# Altium project Fob_Transmitter_V4.0.PrjPcb (part 3 of 3)
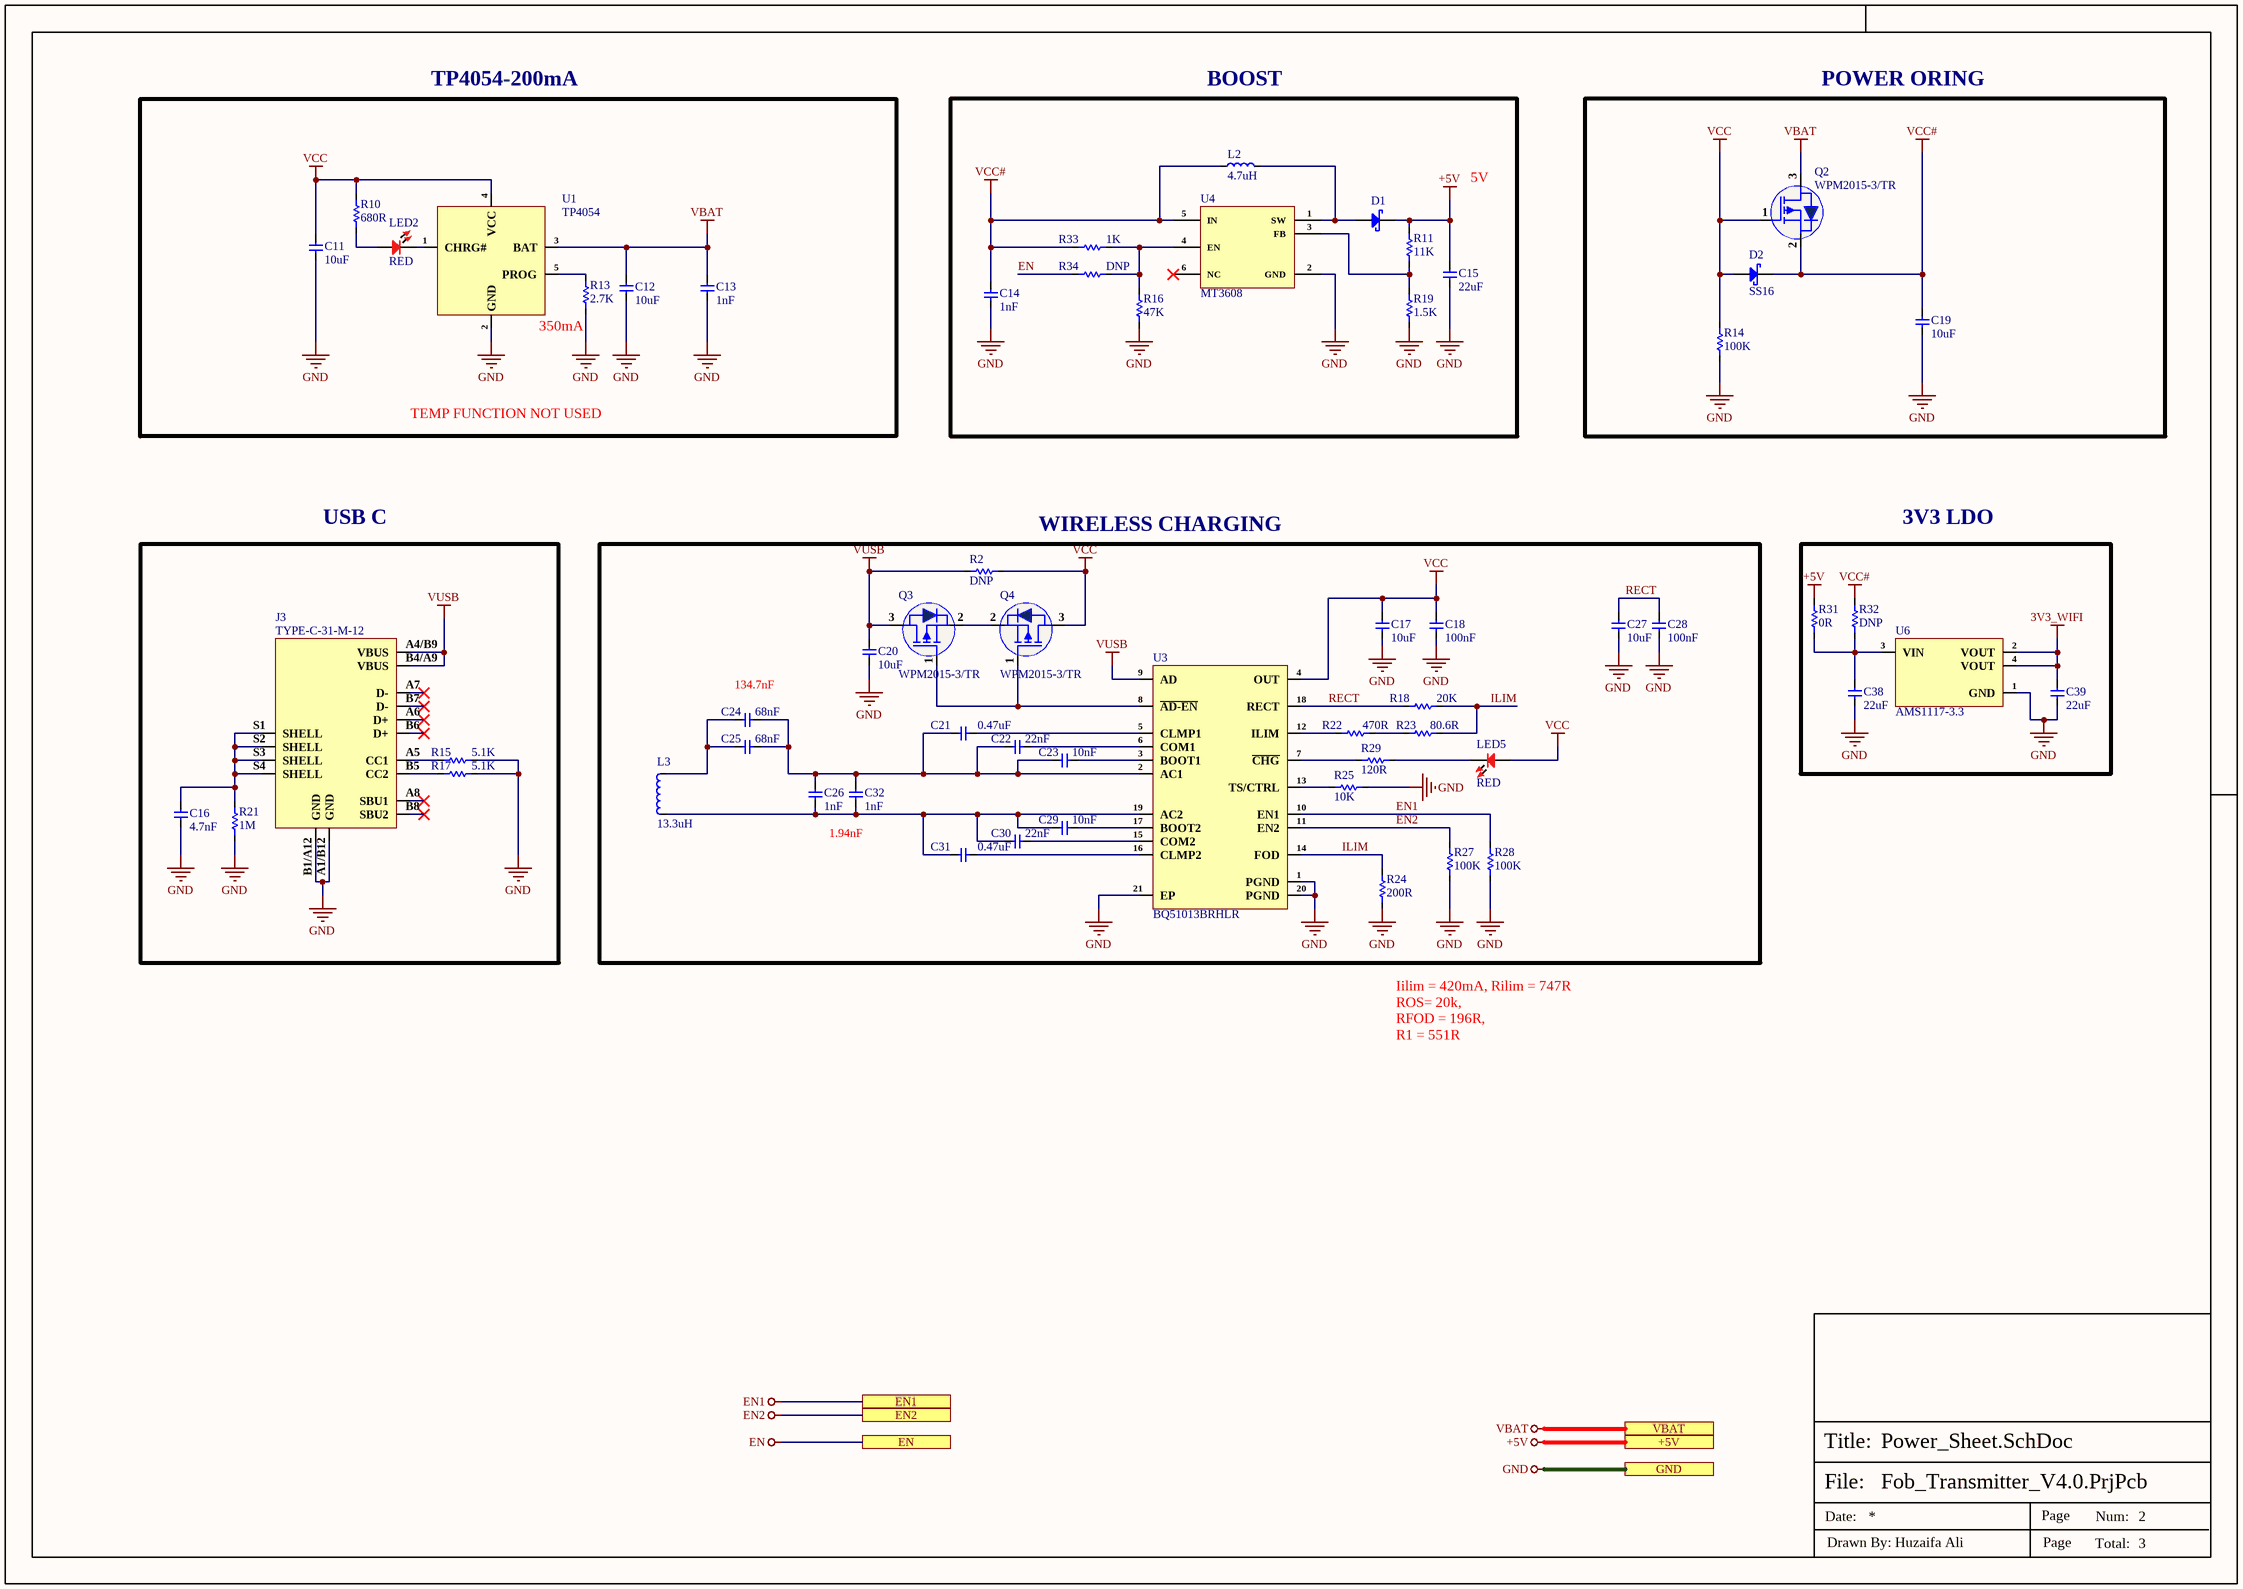
[diagram p4: Power_Sheet.SchDoc]

## Sheet Power_Sheet.SchDoc (continued)

### Library data of the parts (continued)
U6 = AMS1117-3.3: SOT-223 Linear Voltage Regulators (LDO) ROHS; Manufacturer: GUOXIN JIAPIN SEMICONDUCTOR; Item Type: IC; Manufacturer Part Number: AMS1117-3.3; Package: SOT-223; LCSC Part Number: C2992570; ComponentLink1Description: LCSC; ComponentLink1URL: https://www.lcsc.com/product-detail/Linear-Voltage-Regulators-LDO_GUOXIN-JIAPIN-SEMICONDUCTOR-AMS1117-3-3_C2992570.html

## Sheet Transmitter_Section.SchDoc
size 420 x 297 mm; SheetNumber: 3; SheetTotal: 3
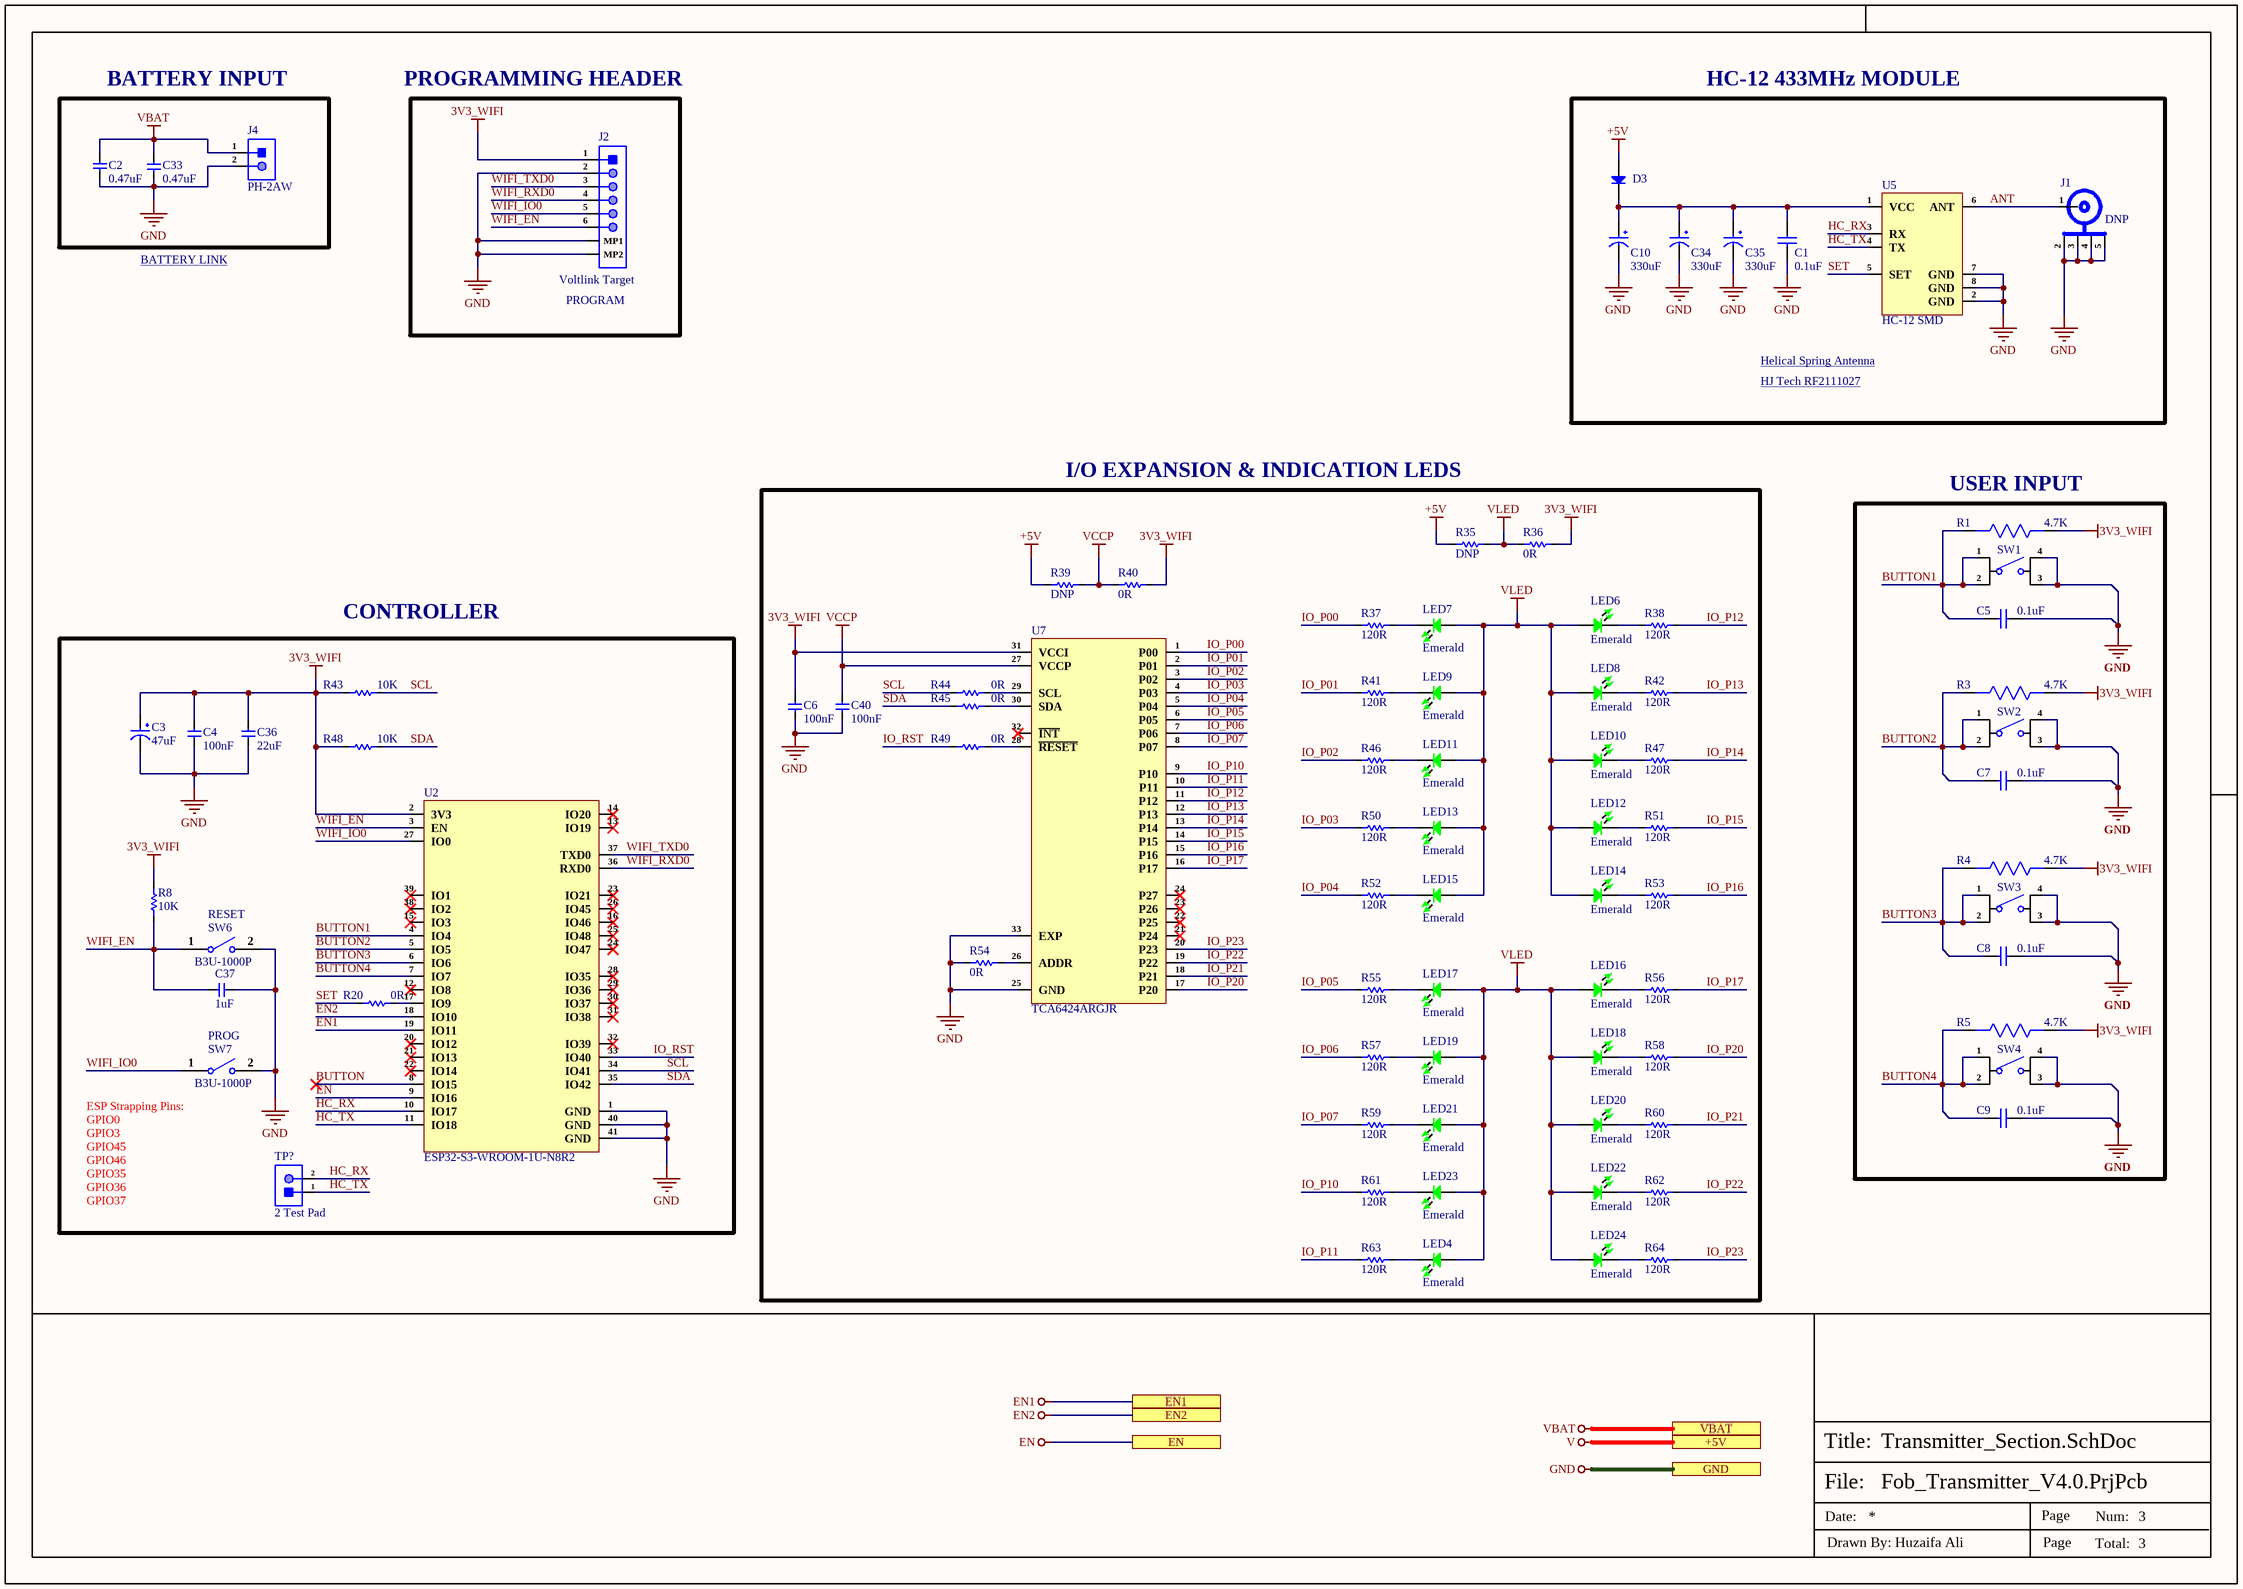
[diagram p2: Transmitter_Section.SchDoc]

### Parts
C1  0.1uF  [Cap0603]
C2  0.47uF  [Cap-0402]
C3  47uF  [Case-B]
C4  100nF  [Cap-0402]
C5  0.1uF  [Cap0603]
C6  100nF  [Cap-0402]
C7  0.1uF  [Cap0603]
C8  0.1uF  [Cap0603]
C9  0.1uF  [Cap0603]
C10  330uF  [Case-D]
C33  0.47uF  [Cap-0603]
C34  330uF  [Case-D]
C35  330uF  [Case-D]
C36  22uF  [Cap-0603]
C37  1uF  [Cap-0402]
C40  100nF  [Cap-0402]
D3  1N4007- SMD  [SMA(DO-214AC)]  (value not drawn)
J1  DNP  [CON-SMA-EDGE_S]
J2  Voltlink Target  [Voltlink Target]
J4  PH-2AW  [PH-2AW]
LED4  Emerald  [LED-0603]
LED6  Emerald  [LED-0603]
LED7  Emerald  [LED-0603]
LED8  Emerald  [LED-0603]
LED9  Emerald  [LED-0603]
LED10  Emerald  [LED-0603]
LED11  Emerald  [LED-0603]
LED12  Emerald  [LED-0603]
LED13  Emerald  [LED-0603]
LED14  Emerald  [LED-0603]
LED15  Emerald  [LED-0603]
LED16  Emerald  [LED-0603]
LED17  Emerald  [LED-0603]
LED18  Emerald  [LED-0603]
LED19  Emerald  [LED-0603]
LED20  Emerald  [LED-0603]
LED21  Emerald  [LED-0603]
LED22  Emerald  [LED-0603]
LED23  Emerald  [LED-0603]
LED24  Emerald  [LED-0603]
R1  4.7K  [RES-0603]
R3  4.7K  [RES-0603]
R4  4.7K  [RES-0603]
R5  4.7K  [RES-0603]
R8  10K  [Res-0402]
R20  0R  [Res-0402]
R35  DNP  [Res-0603]
R36  0R  [Res-0603]
R37  120R  [Res-0402]
R38  120R  [Res-0402]
R39  DNP  [Res-0603]
R40  0R  [Res-0603]
R41  120R  [Res-0402]
R42  120R  [Res-0402]
R43  10K  [Res-0402]
R44  0R  [Res-0402]
R45  0R  [Res-0402]
R46  120R  [Res-0402]
R47  120R  [Res-0402]
R48  10K  [Res-0402]
R49  0R  [Res-0402]
R50  120R  [Res-0402]
R51  120R  [Res-0402]
R52  120R  [Res-0402]
R53  120R  [Res-0402]
R54  0R  [Res-0402]
R55  120R  [Res-0402]
R56  120R  [Res-0402]
R57  120R  [Res-0402]
R58  120R  [Res-0402]
R59  120R  [Res-0402]
R60  120R  [Res-0402]
R61  120R  [Res-0402]
R62  120R  [Res-0402]
R63  120R  [Res-0402]
R64  120R  [Res-0402]
SW1  TSA016A2518A  [TSA016A2518A]  (value not drawn)
SW2  TSA016A2518A  [TSA016A2518A]  (value not drawn)
SW3  TSA016A2518A  [TSA016A2518A]  (value not drawn)
SW4  TSA016A2518A  [TSA016A2518A]  (value not drawn)
SW6  B3U-1000P  [B3U-1000P]
SW7  B3U-1000P  [B3U-1000P]
TP?  2 Test Pad  [2 Test Pad]  (no BOM)
U2  ESP32-S3-WROOM-1U-N8R2  [41-SMD UFL Module]
U5  HC-12 SMD  [HC-12 Module SMD]
U7  TCA6424ARGJR  [32-UQFN (5x5)]

### Blocks framed on the sheet
BATTERY INPUT: C2 C33 J4
PROGRAM: J2
HC-12 433MHz MODULE: C1 C10 C34 C35 D3 J1 U5
I/O EXPANSION & INDICATION LEDS: C6 C40 LED4 LED6-LED24 R35-R42 R44-R47 R49-R64 U7
USER INPUT: C5 C7-C9 R1 R3-R5 SW1-SW4
CONTROLLER: C3 C4 C36 C37 R8 R20 R43 R48 SW6 SW7 TP? U2

### Ports
+5V, EN, EN1, EN2, GND, VBAT

### Nets
3V3_WIFI: C3.1 C4.2 C6.2 C36.2 J2.1 R1.1 R3.1 R4.1 R5.1 R8.2 R36.2 R40.2 R43.1 R48.1 U2.2(3V3) U7.31(VCCI)
+5V: D3.2(A) R35.1 R39.1 ; port +5V  [also labelled V]
EN: U2.9(IO16) ; port EN
EN1: U2.19(IO11) ; port EN1
EN2: U2.18(IO10) ; port EN2
GND: C1.2 C2.2 C3.2 C4.1 C5.2 C6.1 C7.2 C8.2 C9.2 C10.2 C33.1 C34.2 C35.2 C36.1 C37.1 C40.1 J1.2(GND) J1.3(GND) J1.4(GND) J1.5(GND) J2.2 J2.MP1 J2.MP2 J4.2 R54.1 SW1.3 SW1.4 SW2.3 SW2.4 SW3.3 SW3.4 SW4.3 SW4.4 SW6.2 SW7.2 U2.1(GND) U2.40(GND) U2.41(GND) U5.2(GND) U5.7(GND) U5.8(GND) U7.25(GND) U7.33(EXP) ; port GND
VBAT: C2.1 C33.2 J4.1 ; port VBAT
VCCP: C40.2 R39.2 R40.1 U7.27(VCCP)
VLED: LED4.1 LED6.1 LED7.1 LED8.1 LED9.1 LED10.1 LED11.1 LED12.1 LED13.1 LED14.1 LED15.1 LED16.1 LED17.1 LED18.1 LED19.1 LED20.1 LED21.1 LED22.1 LED23.1 LED24.1 R35.2 R36.1
ANT: J1.1(ANT) U5.6(ANT)
BUTTON: U2.8(IO15)
BUTTON1: C5.1 R1.2 SW1.1 SW1.2 U2.4(IO4)
BUTTON2: C7.1 R3.2 SW2.1 SW2.2 U2.5(IO5)
BUTTON3: C8.1 R4.2 SW3.1 SW3.2 U2.6(IO6)
BUTTON4: C9.1 R5.2 SW4.1 SW4.2 U2.7(IO7)
HC_RX: TP?.2 U2.10(IO17) U5.3(RX)
HC_TX: TP?.1 U2.11(IO18) U5.4(TX)
IO_P00: R37.2 U7.1(P00)
IO_P01: R41.2 U7.2(P01)
IO_P02: R46.2 U7.3(P02)
IO_P03: R50.2 U7.4(P03)
IO_P04: R52.2 U7.5(P04)
IO_P05: R55.2 U7.6(P05)
IO_P06: R57.2 U7.7(P06)
IO_P07: R59.2 U7.8(P07)
IO_P10: R61.2 U7.9(P10)
IO_P11: R63.2 U7.10(P11)
IO_P12: R38.1 U7.11(P12)
IO_P13: R42.1 U7.12(P13)
IO_P14: R47.1 U7.13(P14)
IO_P15: R51.1 U7.14(P15)
IO_P16: R53.1 U7.15(P16)
IO_P17: R56.1 U7.16(P17)
IO_P20: R58.1 U7.17(P20)
IO_P21: R60.1 U7.18(P21)
IO_P22: R62.1 U7.19(P22)
IO_P23: R64.1 U7.20(P23)
IO_RST: R49.1 U2.33(IO40)
SCL: R43.2 R44.1 U2.34(IO41)
SDA: R45.1 R48.2 U2.35(IO42)
SET: R20.1 U5.5(SET)
WIFI_EN: C37.2 J2.6 R8.1 SW6.1 U2.3(EN)
WIFI_IO0: J2.5 SW7.1 U2.27(IO0)
WIFI_RXD0: J2.4 U2.36(RXD0)
WIFI_TXD0: J2.3 U2.37(TXD0)
NetC1_1: C1.1 C10.1 C34.1 C35.1 D3.1(K) U5.1(VCC)
NetLED4_2: LED4.2 R63.1
NetLED6_2: LED6.2 R38.2
NetLED7_2: LED7.2 R37.1
NetLED8_2: LED8.2 R42.2
NetLED9_2: LED9.2 R41.1
NetLED10_2: LED10.2 R47.2
NetLED11_2: LED11.2 R46.1
NetLED12_2: LED12.2 R51.2
NetLED13_2: LED13.2 R50.1
NetLED14_2: LED14.2 R53.2
NetLED15_2: LED15.2 R52.1
NetLED16_2: LED16.2 R56.2
NetLED17_2: LED17.2 R55.1
NetLED18_2: LED18.2 R58.2
NetLED19_2: LED19.2 R57.1
NetLED20_2: LED20.2 R60.2
NetLED21_2: LED21.2 R59.1
NetLED22_2: LED22.2 R62.2
NetLED23_2: LED23.2 R61.1
NetLED24_2: LED24.2 R64.2
NetR20_2: R20.2 U2.17(IO9)
NetR44_2: R44.2 U7.29(SCL)
NetR45_2: R45.2 U7.30(SDA)
NetR49_2: R49.2 U7.28(~{RESET})
NetR54_2: R54.2 U7.26(ADDR)

Not connected (* = marked no-connect by the designer): U2 12(IO8)* 13(IO19)* 14(IO20)* 15(IO3)* 16(IO46)* 20(IO12)* 21(IO13)* 22(IO14)* 23(IO21)* 24(IO47)* 25(IO48)* 26(IO45)* 28(IO35)* 29(IO36)* 30(IO37)* 31(IO38)* 32(IO39)* 38(IO2)* 39(IO1)*; U7 21(P24)* 22(P25)* 23(P26)* 24(P27)* 32(~{INT})*

### Notes on the sheet
- PROGRAMMING HEADER
- BATTERY LINK <https://vi.aliexpress.com/item/1005002734730431.html?spm=a2g0o.productlist.main.55.4fba3caeNMDezl&algo_pvid=2e614eb3-25ad-491b-9c35-52edbbf668ee&aem_p4p_detail=202408080529024132438273507200000717928&algo_exp_id=2e614eb3-25ad-491b-9c35-52edbbf668ee-27&pdp_npi=4%40dis%21USD%2113.00%218.60%21%21%2113.00%218.60%21%402141111917231201422858072e9bee%2112000028368129547%21sea%21AU%210%21ABX&curPageLogUid=a248Mxs1e3zy&utparam-url=scene%3Asearch%7Cquery_from%3A&search_p4p_id=202408080529024132438273507200000717928_7>
- Helical Spring Antenna <https://www.lcsc.com/product-detail/Antennas_Vollgo-VG433SNX39-6W3_C718844.html>
- HJ Tech RF2111027 <https://www.lcsc.com/product-detail/Antennas_HJ-Tech-RF2111027_C2936948.html>
- (near SW6) RESET
- PROG
- (near SW7) ESP Strapping Pins:
  GPIO0
  GPIO3
  GPIO45
  GPIO46
  GPIO35
  GPIO36
  GPIO37
- File:
- Title:
- Date:
- Page
- Num:
- Total:
- Drawn By: Huzaifa Ali

### Library data of the parts
C1 C5 C7-C9 = CC0603ZRY5V9BB104: CAP CER 0.1UF 50V Y5V 0603; Manufacturer: Yageo; Capacitance: 100nF; Tolerance: 80%; Supplier 1: Digi-Key; Manufacturer Part Number: CC0603ZRY5V9BB104; Stock 1: 15000880; Pricing 1: 1=0.1, 10=0.075, 100=0.0334, 500=0.02386, 1000=0.01874 (USD); Mount: Surface Mount; Case/Package: 0603; Number of Pins: 2; Case Code (Metric): 1608; Case Code (Imperial): 0603; Min Operating Temperature: -30°C; Max Operating Temperature: 85°C; Dielectric: Y5V; Voltage Rating: 50V; Package Quantity: 1; Packaging: Tape and Reel; Voltage Rating (DC): 50V; Termination: SMD/SMT; Composition: Ceramic; Voltage: 50V; Length: 1.6mm; Height: 0.8mm; Width: 0.031inch; Thickness: 0.035inch; Depth: 0.8mm; Radiation Hardening: No; REACH SVHC: No SVHC; Lead Free: Lead Free; Halogen Free: Halogen Free; ComponentLink1URL: http://www.yageo.com/documents/recent/UPY-GPHC_Y5V_6.3V-to-50V_8.pdf?src-supplier=Digi-Key; ComponentLink1Description: http://www.yageo.com/documents/recent/UPY-GPHC_Y5V_6.3V-to-50V_8.pdf?src-supplier=Digi-Key; ComponentLink2URL: http://www.yageo.com/documents/recent/UPY-GPHC_Y5V_6.3V-to-50V_5.pdf?src-supplier=Avnet+Europe; ComponentLink2Description: http://www.yageo.com/documents/recent/UPY-GPHC_Y5V_6.3V-to-50V_5.pdf?src-supplier=Avnet+Europe; ComponentLink3URL: https://www.verical.com/server-webapp/html/getDatasheet?partID=403611&src-supplier=Verical; ComponentLink3Description: https://www.verical.com/server-webapp/html/getDatasheet?partID=403611&src-supplier=Verical; ComponentLink4URL: http://www.mouser.com/ds/2/447/Yageo_UPY-GP_NP0_16V-to-50V_9-358835.pdf?src-supplier=Mouser; ComponentLink4Description: http://www.mouser.com/ds/2/447/Yageo_UPY-GP_NP0_16V-to-50V_9-358835.pdf?src-supplier=Mouser; ComponentLink5URL: http://www.farnell.com/datasheets/1132289.pdf?src-supplier=Element14; ComponentLink5Description: http://www.farnell.com/datasheets/1132289.pdf?src-supplier=Element14; Supplier Part Number 1: 311-1343-1-ND
C2 = CC0402KRX5R7BB474: CAP CER 0.47UF 16V X5R 0402; Manufacturer: Yageo; Capacitance: 470nF; Tolerance: 10%; Item Type: Capacitor; Supplier 1: Future Electronics; Manufacturer Part Number: CC0402KRX5R7BB474; RoHS: Yes; Category: Ceramic Capacitors; Stock 1: 10000; Pricing 1: 10000=0.01840, 20000=0.01800, 40000=0.01760, 50000=0.01750, 150000=0.01670 (USD); Mount: Surface Mount; Case/Package: 0402; Min Operating Temperature: -55°C; Max Operating Temperature: 85°C; Packaging: Tape and Reel; Voltage Rating: 16V; Voltage Rating (DC): 16V; Length: 0.039inch; Width: 0.02inch; Thickness: 0.022inch; Lead Free: Lead Free; Halogen Free: Halogen Free; RoHS Compliant: Yes; ComponentLink1URL: http://www.yageo.com/documents/recent/UPY-GPHC_X5R_4V-to-50V_25.pdf?src-supplier=Digi-Key; ComponentLink1Description: http://www.yageo.com/documents/recent/UPY-GPHC_X5R_4V-to-50V_25.pdf?src-supplier=Digi-Key; ComponentLink2URL: http://www.yageo.com/exep/pages/download/literatures/ProductSelectionGuide%202014_Final_2.pdf?src-supplier=Digi-Key; ComponentLink2Description: http://www.yageo.com/exep/pages/download/literatures/ProductSelectionGuide%202014_Final_2.pdf?src-supplier=Digi-Key; Supplier Part Number 1: 1070400; LCSC Part Number: C527010
C3 = TPSB476K010R0250: CAP TANT 47UF 10% 10V 1411; Manufacturer: Kyocera AVX; Item Type: Tantalum Capacitors; Life (Hours): 2000Hour; Ripple Current: 583mA; Supplier: Digikey; LCSC Part Number: C308881; Manufacturer Part Number: TPSB476K010R0250; RoHS: Yes; Stock: 118032; Pricing: 1=0.78, 10=0.488, 50=0.3748, 100=0.3397, 500=0.28054, 1000=0.26226 (USD); Lead Free: 5697LeadFree; RoHS Compliant: 5897YesNo; ComponentLink1URL: https://datasheet.ciiva.com/16328/tps-16328667.pdf?src-supplier=Future+Electronics; ComponentLink1Description: https://datasheet.ciiva.com/16328/tps-16328667.pdf?src-supplier=Future+Electronics; ComponentLink2URL: https://datasheet.ciiva.com/7713/1680477-7713437.pdf?src-supplier=Element14; ComponentLink2Description: https://datasheet.ciiva.com/7713/1680477-7713437.pdf?src-supplier=Element14; ComponentLink3URL: https://datasheet.ciiva.com/14590/70001047-14590282.pdf?src-supplier=Allied+Electronics; ComponentLink3Description: https://datasheet.ciiva.com/14590/70001047-14590282.pdf?src-supplier=Allied+Electronics; ComponentLink4URL: https://datasheet.ciiva.com/14593/70001047-14593294.pdf?src-supplier=Allied+Electronics; ComponentLink4Description: https://datasheet.ciiva.com/14593/70001047-14593294.pdf?src-supplier=Allied+Electronics; ComponentLink5URL: https://datasheet.ciiva.com/3004/tps-3004609.pdf?src-supplier=Avnet; ComponentLink5Description: https://datasheet.ciiva.com/3004/tps-3004609.pdf?src-supplier=Avnet; ComponentLink6URL: https://datasheet.ciiva.com/264/tps-264094.pdf?src-supplier=Digikey; ComponentLink6Description: https://datasheet.ciiva.com/264/tps-264094.pdf?src-supplier=Digikey; ComponentLink7URL: https://datasheet.ciiva.com/264/tps-264095.pdf?src-supplier=Digikey; ComponentLink7Description: https://datasheet.ciiva.com/264/tps-264095.pdf?src-supplier=Digikey; ComponentLink8URL: https://datasheet.ciiva.com/264/tps-264096.pdf?src-supplier=Digikey; ComponentLink8Description: https://datasheet.ciiva.com/264/tps-264096.pdf?src-supplier=Digikey
C4 C6 C40 = CC0402KRX5R8BB104: CAP CER 0.1UF 25V X5R 0402; Manufacturer: Yageo; Tolerance: 10%; Item Type: Capacitor; Supplier 1: Digi-Key; Manufacturer Part Number: CC0402KRX5R8BB104; RoHS: Yes; Category: Ceramic Capacitors; Stock 1: 4598218; Pricing 1: 1=0.10000, 10=0.03800, 50=0.02100, 100=0.01710, 500=0.01224, 1000=0.00961, 2500=0.00874, 5000=0.00804 (USD); Mount: Surface Mount; Case/Package: 0402; Case Code (Metric): 1005; Case Code (Imperial): 0402; Min Operating Temperature: -55°C; Max Operating Temperature: 85°C; Voltage Rating: 25V; Packaging: Tape and Reel; Capacitance: 100nF; Voltage Rating (DC): 25V; Dielectric: X5R; Resistor Type: Ceramic; Series: CC; Length: 0.039inch; Width: 0.02inch; Thickness: 0.022inch; Depth: 0.5mm; Lead Free: Lead Free; Halogen Free: Halogen Free; RoHS Compliant: Yes; ComponentLink1URL: http://www.mouser.com/ds/2/447/UPY-GPHC_X5R_4V-to-50V_25-1131599.pdf?src-supplier=Mouser; ComponentLink1Description: http://www.mouser.com/ds/2/447/UPY-GPHC_X5R_4V-to-50V_25-1131599.pdf?src-supplier=Mouser; ComponentLink2URL: http://www.yageo.com/documents/recent/UPY-GPHC_X5R_4V-to-50V-16.pdf?src-supplier=Future+Electronics; ComponentLink2Description: http://www.yageo.com/documents/recent/UPY-GPHC_X5R_4V-to-50V-16.pdf?src-supplier=Future+Electronics; ComponentLink3URL: http://www.yageo.com/documents/recent/UPY-GPHC_X5R_4V-to-50V_25.pdf?src-supplier=Digi-Key; ComponentLink3Description: http://www.yageo.com/documents/recent/UPY-GPHC_X5R_4V-to-50V_25.pdf?src-supplier=Digi-Key; Supplier Part Number 1: 311-1697-1-ND; LCSC Part Number: C106256
C10 C34 C35 = TAJD337K010RNJ: CAP TANT 330UF 10% 10V 2917; Manufacturer: Kyocera AVX; Item Type: Capacitor; Dielectric Material: 5684ConductorMaterial; Life (Hours): 1000Hour; Ripple Current: 408mA; Manufacturer Part Number: TAJD337K010RNJ; LCSC Part Number: C7226; ComponentLink1Description: https://datasheet.ciiva.com/11794/0900766b802e69d0-11794408.pdf?src-supplier=Rs; ComponentLink1URL: https://datasheet.ciiva.com/11794/0900766b802e69d0-11794408.pdf?src-supplier=Rs; Supplier: Avnet; RoHS: Yes; Stock: 24500; Pricing: 500=0.37263 (USD); Lead Free: 5697LeadFree; ComponentLink2URL: https://datasheet.ciiva.com/19467/1236841-19467295.pdf?src-supplier=Jameco; ComponentLink2Description: https://datasheet.ciiva.com/19467/1236841-19467295.pdf?src-supplier=Jameco; Voltage Rating (AC): 10V; ComponentLink3URL: https://datasheet.ciiva.com/26944/getdatasheetpartid-149137-26944845.pdf?src-supplier=Verical; ComponentLink3Description: https://datasheet.ciiva.com/26944/getdatasheetpartid-149137-26944845.pdf?src-supplier=Verical; ComponentLink4URL: https://datasheet.ciiva.com/3004/taj-3004541.pdf?src-supplier=Avnet; ComponentLink4Description: https://datasheet.ciiva.com/3004/taj-3004541.pdf?src-supplier=Avnet; ComponentLink5URL: https://datasheet.ciiva.com/3004/taj-3004542.pdf?src-supplier=Avnet; ComponentLink5Description: https://datasheet.ciiva.com/3004/taj-3004542.pdf?src-supplier=Avnet; ComponentLink6URL: https://datasheet.ciiva.com/265/taj-265298.pdf?src-supplier=Digikey; ComponentLink6Description: https://datasheet.ciiva.com/265/taj-265298.pdf?src-supplier=Digikey; ComponentLink7URL: https://datasheet.ciiva.com/265/taj-265299.pdf?src-supplier=Digikey; ComponentLink7Description: https://datasheet.ciiva.com/265/taj-265299.pdf?src-supplier=Digikey; ComponentLink8URL: https://datasheet.ciiva.com/265/taj-265300.pdf?src-supplier=Digikey; ComponentLink8Description: https://datasheet.ciiva.com/265/taj-265300.pdf?src-supplier=Digikey; ComponentLink9URL: https://datasheet.ciiva.com/7832/1680476-7832489.pdf?src-supplier=Element14; ComponentLink9Description: https://datasheet.ciiva.com/7832/1680476-7832489.pdf?src-supplier=Element14; ComponentLink10URL: https://datasheet.ciiva.com/7832/1680476-7832490.pdf?src-supplier=Element14; ComponentLink10Description: https://datasheet.ciiva.com/7832/1680476-7832490.pdf?src-supplier=Element14; ComponentLink11URL: https://datasheet.ciiva.com/7832/1680476-7832491.pdf?src-supplier=Element14; ComponentLink11Description: https://datasheet.ciiva.com/7832/1680476-7832491.pdf?src-supplier=Element14
C33 = CC0603KRX5R9BB474: CAP CER 0.47UF 50V X5R 0603; Manufacturer: Yageo; Capacitance: 470nF; Tolerance: 10%; Item Type: Capacitor; Supplier 1: Digi-Key; Manufacturer Part Number: CC0603KRX5R9BB474; RoHS: Yes; Category: Ceramic Capacitors; Stock 1: 15145; Pricing 1: 1=0.45000, 10=0.31400, 50=0.22000, 100=0.18860, 500=0.14144, 1000=0.11944 (USD); Mount: Surface Mount; Case/Package: 0603; Min Operating Temperature: -55°C; Max Operating Temperature: 85°C; Packaging: Tape and Reel; Voltage Rating: 50V; Voltage Rating (DC): 50V; Dielectric: X5R; Length: 0.063inch; Width: 0.031inch; Thickness: 0.035inch; Lead Free: Lead Free; Halogen Free: Halogen Free; RoHS Compliant: Yes; ComponentLink1URL: https://www.mouser.com/ds/2/447/ProductSelectionGuide 2014_Final_2-1131690.pdf?src-supplier=Mouser; ComponentLink1Description: https://www.mouser.com/ds/2/447/ProductSelectionGuide 2014_Final_2-1131690.pdf?src-supplier=Mouser; ComponentLink2URL: http://www.yageo.com/documents/recent/UPY-GPHC_X5R_4V-to-50V_25.pdf?src-supplier=Digi-Key; ComponentLink2Description: http://www.yageo.com/documents/recent/UPY-GPHC_X5R_4V-to-50V_25.pdf?src-supplier=Digi-Key; ComponentLink3URL: http://www.yageo.com/exep/pages/download/literatures/ProductSelectionGuide%202014_Final_2.pdf?src-supplier=Digi-Key; ComponentLink3Description: http://www.yageo.com/exep/pages/download/literatures/ProductSelectionGuide%202014_Final_2.pdf?src-supplier=Digi-Key; Supplier Part Number 1: 311-4047-1-ND; LCSC Part Number: C513651
C36 = CC0603MRX5R6BB226: CAP CER 22UF 10V X5R 0603; Manufacturer: Yageo; Tolerance: 20%; Item Type: Capacitor; Supplier 1: Digi-Key; Manufacturer Part Number: CC0603MRX5R6BB226; RoHS: Yes; Category: Ceramic Capacitors; Stock 1: 19628; Pricing 1: 1=0.68000, 10=0.48000, 50=0.36300, 100=0.31610, 500=0.23416, 1000=0.19903 (USD); Mount: Surface Mount; Case/Package: 0603; Case Code (Metric): 1608; Case Code (Imperial): 0603; Weight: 7.1E-05oz; Min Operating Temperature: -55°C; Max Operating Temperature: 85°C; Packaging: Tape and Reel; Capacitance: 22uF; Voltage Rating: 10V; Dielectric: X5R; Termination: SMD/SMT; Voltage Rating (DC): 10V; Package Quantity: 4000; Length: 0.063inch; Width: 0.8mm; Height: 0.8mm; Thickness: 0.035inch; Lead Free: Lead Free; Halogen Free: Halogen Free; RoHS Compliant: Yes; ComponentLink1URL: http://www.mouser.com/ds/2/447/Yageo_UPY-GP_NP0_16V-to-50V_9-358835.pdf?src-supplier=Mouser; ComponentLink1Description: http://www.mouser.com/ds/2/447/Yageo_UPY-GP_NP0_16V-to-50V_9-358835.pdf?src-supplier=Mouser; ComponentLink2URL: http://www.yageo.com/documents/recent/UPY-GPHC_X5R_4V-to-50V_25.pdf?src-supplier=Digi-Key; ComponentLink2Description: http://www.yageo.com/documents/recent/UPY-GPHC_X5R_4V-to-50V_25.pdf?src-supplier=Digi-Key; Supplier Part Number 1: 311-1819-1-ND; LCSC Part Number: C109447
C37 = GRM155C71C105KE11D: CAP CER 1UF 16V X7S 0402; Manufacturer: Murata; Item Type: Capacitors; Material: 4241ConductorMaterial; Tolerance: 10%; Dielectric: 1542DielectricType; Supplier: Mouser; LCSC Part Number: C576449; Manufacturer Part Number: GRM155C71C105KE11D; RoHS: No; Stock: 16102; Pricing: 1=0.11, 10=0.041, 50=0.041, 100=0.026, 1000=0.023, 10000=0.016 (USD); Case/Package: 343Case; Min Operating Temperature: -55°C; Max Operating Temperature: 125°C; Value: 1uF; Voltage Rating: 16V; Voltage Rating (DC): 16V; Length: 1mm; Width: 500um; Height: 600um; Thickness: 500um
D3 = 1N4007- SMD: 1A Single 1kV 1.1V@1A SMA(DO-214AC) Diodes - General Purpose ROHS; Manufacturer: TWGMC; Manufacturer Part Number: 1N4007; Item Type: Diode; Package: SMA(DO-214AC); LCSC Part Number: C727081; ComponentLink1Description: LCSC; ComponentLink1URL: https://www.lcsc.com/product-detail/Diodes-General-Purpose_TWGMC-1N4007_C727081.html
J1 = CON-SMA-EDGE-S: Sma Female Connector, Pcb Edge Mount Rohs Compliant: Yes; Manufacturer: RF Solutions; Number of Ports: 1; Supplier 1: Rs; Manufacturer Part Number: CON-SMA-EDGE-S; RoHS: Yes; Category: RF / Coaxial Connectors; Stock 1: 4145; Pricing 1: 1=1.16, 10=0.96 (GBP); Mount: Edge,Board; Case/Package: SMA; Connector Type: SMA; Fastening Type: Threaded; Termination: Solder; Series: -; ComponentLink1URL: https://media.digikey.com/pdf/Data%20Sheets/RF%20Solutions%20PDFs/CON-SMA-EDGE.pdf?src-supplier=Digi-Key; ComponentLink1Description: https://media.digikey.com/pdf/Data%20Sheets/RF%20Solutions%20PDFs/CON-SMA-EDGE.pdf?src-supplier=Digi-Key; Package: THT; Item Type: Connector; Supplier Part Number 1: 1258191
J2 = C145963: 1x6P SH 1 1mm 6 SMD,P=1mm Wire To Board / Wire To Wire Connector ROHS; Manufacturer: BOOMELE; Manufacturer Part Number: C145963; Package: SMD,P=1mm; LCSC Part Number: C145963; Item Type: Connector; ComponentLink1Description: LCSC; ComponentLink1URL: https://www.lcsc.com/product-detail/Wire-To-Board-Wire-To-Wire-Connector_BOOMELE-Boom-Precision-Elec-C145963_C145963.html
J4 = PH-2AW: 1x2P 2P PH 1 Tin 2mm 2 -25℃~+85℃ Brass 2A Bend insert Push-Pull,P=2mm Wire To Board Connector ROHS; Manufacturer: HCTL; Manufacturer Part Number: PH-2AW; Package: Push-Pull,P=2mm; LCSC Part Number: C2908634; Item Type: Wire To Board Connector; ComponentLink1Description: LCSC; ComponentLink1URL: https://www.lcsc.com/product-detail/Wire-To-Board-Connector_HCTL-PH-2AW_C2908634.html
LED4 LED6-LED24 = NCD0603G2: Emerald 0603 Light Emitting Diodes (LED) ROHS; Manufacturer: Foshan NationStar Optoelectronics; Manufacturer Part Number: NCD0603G2; Package: 0603; LCSC Part Number: C87326; Item Type: LED; ComponentLink1Description: LCSC; ComponentLink1URL: https://www.lcsc.com/product-detail/Light-Emitting-Diodes-LED_Foshan-NationStar-Optoelectronics-NCD0603G2_C87326.html
R1 R3-R5 = RC0603FR-074K7L: RES SMD 4.7K OHM 1% 1/10W 0603; Manufacturer: Yageo; Resistance: 4.7kR; Temperature Coefficient: 100ppm/°C; Power Rating: 100mW; Voltage Rating (DC): 50V; Supplier 1: Digi-Key; Manufacturer Part Number: RC0603FR-074K7L; RoHS: Yes; Category: Chip SMD Resistors; Stock 1: 1924316; Pricing 1: 1=0.10000, 10=0.02400, 100=0.00970, 1000=0.00436, 2500=0.00378 (USD); Case/Package: 0603; Number of Pins: 2; Case Code (Imperial): 0603; Case Code (Metric): 1608; Size Code: 0603; Min Operating Temperature: -55°C; Max Operating Temperature: 155°C; Tolerance: 1%; Resistor Type: Thick Film; Packaging: Tape and Reel; Voltage Rating: 50V; Termination: SMD/SMT; Features: Moisture Resistant; Series: RC; Max Power Dissipation: 100mW; Number of Terminations: 2; Construction: Rectangular; Resistance Tolerance: 1%; Length: 1.6mm; Width: 0.8mm; Height: 0.45mm; Depth: 0.8mm; Lead Pitch: 0.3mm; REACH SVHC: No SVHC; Lead Free: Lead Free; RoHS Compliant: Yes; Military Standard: Not; ComponentLink1URL: https://datasheet.ciiva.com/15189/getdatasheetpartid-422754-15189760.pdf?src-supplier=Verical; ComponentLink1Description: https://datasheet.ciiva.com/15189/getdatasheetpartid-422754-15189760.pdf?src-supplier=Verical; ComponentLink2URL: https://datasheet.ciiva.com/22747/443971-22747528.pdf?src-supplier=Element14; ComponentLink2Description: https://datasheet.ciiva.com/22747/443971-22747528.pdf?src-supplier=Element14; ComponentLink3URL: https://datasheet.ciiva.com/7660/38590-7660794.pdf?src-supplier=Element14; ComponentLink3Description: https://datasheet.ciiva.com/7660/38590-7660794.pdf?src-supplier=Element14; ComponentLink4URL: https://datasheet.ciiva.com/7746/1868787-7746365.pdf?src-supplier=Element14; ComponentLink4Description: https://datasheet.ciiva.com/7746/1868787-7746365.pdf?src-supplier=Element14; ComponentLink5URL: https://datasheet.ciiva.com/46440/1868787-46440909.pdf?src-supplier=Element14; ComponentLink5Description: https://datasheet.ciiva.com/46440/1868787-46440909.pdf?src-supplier=Element14; ComponentLink6URL: https://datasheet.ciiva.com/7746/1738695-7746366.pdf?src-supplier=Element14; ComponentLink6Description: https://datasheet.ciiva.com/7746/1738695-7746366.pdf?src-supplier=Element14; Supplier Part Number 1: 311-4.70KHRCT-ND
R8 R43 R48 = RC0402FR-0710KL: RES 10K OHM 1% 1/16W 0402; Manufacturer: Yageo; Resistance: 10kR; Voltage Rating (DC): 50V; Temperature Coefficient: 100ppm/°C; Power Rating: 62.5mW; Max Power Dissipation: 63mW; Item Type: Resistor; Supplier 1: Mouser; Manufacturer Part Number: RC0402FR-0710KL; RoHS: Yes; Category: Chip SMD Resistors; Stock 1: 18648329; Pricing 1: 1=0.10000, 10=0.01400, 50=0.01400, 100=0.00500, 1000=0.00300, 10000=0.00200 (USD); Case/Package: 0402; Number of Pins: 2; Case Code (Imperial): 0402; Case Code (Metric): 1005; Min Operating Temperature: -55°C; Max Operating Temperature: 155°C; Resistor Type: Thick Film; Tolerance: 1%; Packaging: Tape and Reel; Voltage Rating: 50V; Termination: SMD/SMT; Working Voltage: 50V; Number of Terminations: 2; Features: Moisture Resistant; Series: RC; Resistance Tolerance: 1%; Construction: Rectangular; Length: 1mm; Width: 0.5mm; Height: 0.32mm; Depth: 0.5mm; Lead Pitch: 0.2mm; REACH SVHC: No SVHC; Lead Free: Lead Free; RoHS Compliant: Yes; Military Standard: Not; ComponentLink1URL: https://datasheet.ciiva.com/7660/38568-7660787.pdf?src-supplier=Element14; ComponentLink1Description: https://datasheet.ciiva.com/7660/38568-7660787.pdf?src-supplier=Element14; ComponentLink2URL: https://datasheet.ciiva.com/7849/1686128-7849814.pdf?src-supplier=Element14; ComponentLink2Description: https://datasheet.ciiva.com/7849/1686128-7849814.pdf?src-supplier=Element14; ComponentLink3URL: https://datasheet.ciiva.com/7983/1018594-7983486.pdf?src-supplier=Element14; ComponentLink3Description: https://datasheet.ciiva.com/7983/1018594-7983486.pdf?src-supplier=Element14; ComponentLink4URL: https://datasheet.ciiva.com/22747/1018594-22747512.pdf?src-supplier=Element14; ComponentLink4Description: https://datasheet.ciiva.com/22747/1018594-22747512.pdf?src-supplier=Element14; ComponentLink5URL: https://datasheet.ciiva.com/12667/pyu-rc0402-51-rohs-l-6-r-12667067.pdf?src-supplier=Mouser; ComponentLink5Description: https://datasheet.ciiva.com/12667/pyu-rc0402-51-rohs-l-6-r-12667067.pdf?src-supplier=Mouser; ComponentLink6URL: https://datasheet.ciiva.com/7849/1784430-7849813.pdf?src-supplier=Element14; ComponentLink6Description: https://datasheet.ciiva.com/7849/1784430-7849813.pdf?src-supplier=Element14; ComponentLink7URL: https://datasheet.ciiva.com/7849/1784430-7849815.pdf?src-supplier=Element14; ComponentLink7Description: https://datasheet.ciiva.com/7849/1784430-7849815.pdf?src-supplier=Element14; Supplier Part Number 1: 603-RC0402FR-0710KL; LCSC Part Number: C60490
R20 R44 R45 R49 R54 = RC0402FR-070RL: RES 0 OHM JUMPER 1/16W 0402; Manufacturer: Yageo; Item Type: Resistors; Tolerance: 1%; Power Rating: 62.5mW; Voltage Rating: 50V; Temperature Coefficient: 200ppm/°C; Max Power Dissipation: 63mW; Supplier 1: Mouser; Manufacturer Part Number: RC0402FR-070RL; RoHS: Yes; Stock 1: 8556842; Pricing 1: 1=0.10000, 10=0.01400, 50=0.01400, 100=0.00600, 1000=0.00300, 5000=0.00200, 10000=0.00100 (USD); Mount: Surface Mount; Case/Package: 0402; Contact Plating: Tin,Matte; Case Code (Imperial): 0402; Case Code (Metric): 1005; Size Code: 0402; Min Operating Temperature: -55°C; Max Operating Temperature: 155°C; Resistance: 0R; Resistor Type: Thick Film; Packaging: Tape and Reel; Termination: SMD/SMT; Features: Moisture Resistant; Series: RC; Number of Terminations: 2; Length: 1mm; Width: 0.5mm; Height: 0.35mm; Radiation Hardening: No; Lead Free: Lead Free; RoHS Compliant: Yes; ComponentLink1URL: https://datasheet.ciiva.com/8896/pyu-rc0402-51-rohs-l-6-8896149.pdf?src-supplier=Avnet; ComponentLink1Description: https://datasheet.ciiva.com/8896/pyu-rc0402-51-rohs-l-6-8896149.pdf?src-supplier=Avnet; ComponentLink2URL: https://datasheet.ciiva.com/16790/pyu-rc0402-51-rohs-l-6-r-16790444.pdf?src-supplier=Future+Electronics; ComponentLink2Description: https://datasheet.ciiva.com/16790/pyu-rc0402-51-rohs-l-6-r-16790444.pdf?src-supplier=Future+Electronics; Supplier Part Number 1: 603-RC0402FR-070RL; LCSC Part Number: C106231
R35 R36 R39 R40 = RC0603JR-070RL: RES 0 OHM JUMPER 1/10W 0603; Manufacturer: Yageo; Resistance: 0mR; Tolerance: 1%; Power Rating: 100mW; Voltage Rating (DC): 50V; Temperature Coefficient: 200ppm/°C; Resistance Tolerance: 5%; Item Type: Resistor; Supplier 1: Digi-Key; Manufacturer Part Number: RC0603JR-070RL; RoHS: Yes; Category: Chip SMD Resistors; Stock 1: 18081776; Pricing 1: 1=0.10000, 10=0.01700, 25=0.01240, 50=0.00960, 100=0.00700, 250=0.00536, 500=0.00430, 1000=0.00316 (USD); Case/Package: 0603; Number of Pins: 2; Contact Plating: Tin,Matte; Case Code (Imperial): 0603; Case Code (Metric): 1608; Size Code: 0603; Min Operating Temperature: -55°C; Max Operating Temperature: 155°C; Resistor Type: Thick Film; Packaging: Tape and Reel; Termination: SMD/SMT; Series: RC; Technology: THICK FILM; Package Quantity: 5000; Voltage Rating: 50V; Features: Moisture Resistant; Max Power Dissipation: 100mW; Number of Terminations: 2; Construction: Rectangular; Length: 1.6mm; Width: 0.8mm; Height: 0.45mm; Depth: 0.8mm; Radiation Hardening: No; Reach SVHC Compliant: No SVHC; Lead Free: Lead Free; RoHS Compliant: Yes; Military Standard: Not; Supplier Part Number 1: 311-0.0GRCT-ND; LCSC Part Number: C95177
R37 R38 R41 R42 R46 R47 R50-R53 R55-R64 = RC0402FR-07120RL: RES 120 OHM 1% 1/16W 0402; Manufacturer: Yageo; Item Type: Resistors; Power Rating: 62.5mW; Voltage Rating: 50V; Temperature Coefficient: 100ppm/°C; Max Power Dissipation: 63mW; Supplier: Future Electronics; Supplier Part Number: 4529079; Manufacturer Part Number: RC0402FR-07120RL; RoHS: Yes; Stock: 150000; Pricing: 10000=0.0012, 100000=0.0011, 300000=0.001, 750000=0.001, 2000000=0.0009 (USD); Case/Package: 0402; Case Code (Imperial): 0402; Case Code (Metric): 1005; Min Operating Temperature: -55°C; Max Operating Temperature: 155°C; Package Quantity: 1; Value: 120R; Tolerance: 1%; Packaging: Tape and Reel; Termination: SMD/SMT; Resistor Type: Thick Film; Number of Terminations: 2; Features: Moisture Resistant; Series: RC; Resistance Tolerance: 1%; Construction: Rectangular; Technology: THICK FILM; Voltage Rating (AC): 50V; Length: 0.039inch; Width: 0.02inch; Height: 0.016inch; Depth: 0.5mm; Reach SVHC Compliant: No; Military Standard: Not; RoHS Compliant: Yes; Lead Free: 5697LeadFree; ComponentLink1URL: https://datasheet.ciiva.com/12667/pyu-rc0402-51-rohs-l-6-r-12667958.pdf?src-supplier=Mouser; ComponentLink1Description: https://datasheet.ciiva.com/12667/pyu-rc0402-51-rohs-l-6-r-12667958.pdf?src-supplier=Mouser; ComponentLink2URL: https://datasheet.ciiva.com/7849/1018594-7849831.pdf?src-supplier=Element14; ComponentLink2Description: https://datasheet.ciiva.com/7849/1018594-7849831.pdf?src-supplier=Element14; LCSC Part Number: C114758
SW1-SW4 = TSA016A2518A: 3.35mm 2.5mm Oval button 50mA Brick nogging 4.2mm 180gf 12V SMD Tactile Switches ROHS; Manufacturer: BZCN; Manufacturer Part Number: TSA016A2518A; Package: SMD; LCSC Part Number: C2888427; Item Type: Tactile Switch; ComponentLink1Description: LCSC; ComponentLink1URL: https://jlcpcb.com/partdetail/Bzcn-TSA016A2518A/C2888427
SW6 SW7 = B3U-1000P: SWITCH TACTILE SPST-NO 0.05A 12V; Manufacturer: Omron; Mechanical Life: 200000Cycles; Operating Force: 1.5N; Throw Configuration: SPST; Current Rating: 50mA; Contact Resistance: 100mR; Illumination Type: Non-Illuminated,Illuminated; Switch Travel: 0.15mm; Switch Function: Off-Mom; Actuator Type: Standard; Actuator Length: 0.4mm; Ratings: Dust Proof,IP40; ComponentLink1URL: http://www.farnell.com/datasheets/60838.pdf?src-supplier=Farnell; ComponentLink1Description: http://www.farnell.com/datasheets/60838.pdf?src-supplier=Farnell; ComponentLink2URL: http://www.farnell.com/datasheets/60838.pdf?src-supplier=Element14; ComponentLink2Description: http://www.farnell.com/datasheets/60838.pdf?src-supplier=Element14; ComponentLink3URL: https://omronfs.omron.com/en_US/ecb/products/pdf/en-b3u.pdf?src-supplier=Digi-Key; ComponentLink3Description: https://omronfs.omron.com/en_US/ecb/products/pdf/en-b3u.pdf?src-supplier=Digi-Key; ComponentLink4URL: http://www.omron.com/ecb/products/pdf/en-b3u.pdf?src-supplier=Digi-Key; ComponentLink4Description: http://www.omron.com/ecb/products/pdf/en-b3u.pdf?src-supplier=Digi-Key; ComponentLink5URL: https://www.distrelec.biz/Web/Downloads/he/et/B3U_eng_datasheet.pdf?mime=application%2Fpdf&src-supplier=Distrelec; ComponentLink5Description: https://www.distrelec.biz/Web/Downloads/he/et/B3U_eng_datasheet.pdf?mime=application%2Fpdf&src-supplier=Distrelec; ComponentLink6URL: http://www.onlinecomponents.com/productFiles/mf-OM/en-b3u.pdf?src-supplier=Onlinecomponents.com; ComponentLink6Description: http://www.onlinecomponents.com/productFiles/mf-OM/en-b3u.pdf?src-supplier=Onlinecomponents.com; Supplier 1: Digi-Key; Manufacturer Part Number: B3U-1000P; Stock 1: 116454; Pricing 1: 1=1, 10=0.961, 25=0.9064, 50=0.7976, 100=0.7251, 250=0.68888, 500=0.67074, 1000=0.52571 (USD); Mount: Surface Mount; Weight: 0.000776oz; Contact Material: Silver; Min Operating Temperature: -25°C; Max Operating Temperature: 70°C; Packaging: Tape and Reel; Voltage Rating (DC): 12V; Package Quantity: 1; Max Current Rating: 50mA; Termination: SMD/SMT; Orientation: Straight; Max Voltage Rating (DC): 12V; Electrical Life: 200000Cycles; Insulation Resistance: 100MR; Contact Current Rating: 50mA; Length: 4mm; Height: 1.2mm; Depth: 2.5mm; Width: 3mm; REACH SVHC: Unknown; Lead Free: Lead Free; ComponentLink7URL: https://www.verical.com/server-webapp/html/getDatasheet?partID=552554&src-supplier=Verical; ComponentLink7Description: https://www.verical.com/server-webapp/html/getDatasheet?partID=552554&src-supplier=Verical; ComponentLink8URL: http://www.farnell.com/datasheets/1685550.pdf?src-supplier=Element14; ComponentLink8Description: http://www.farnell.com/datasheets/1685550.pdf?src-supplier=Element14; ComponentLink9URL: http://www.farnell.com/datasheets/2610940.pdf?src-supplier=Farnell; ComponentLink9Description: http://www.farnell.com/datasheets/2610940.pdf?src-supplier=Farnell; ComponentLink10URL: https://www.alliedelec.com/m/d/4c8a9ef82804fc3c241a13c1e298fd73.pdf?src-supplier=Allied+Electronics; ComponentLink10Description: https://www.alliedelec.com/m/d/4c8a9ef82804fc3c241a13c1e298fd73.pdf?src-supplier=Allied+Electronics; Supplier Part Number 1: SW1020DKR-ND; LCSC Part Number: C231329; Item Type: Switch
TP? = 2 Test Pad: Wire Connecting Pad; Item Type: Test Point; Manufacturer Part Number: 2 Test Pad
U2 = ESP32-S3-WROOM-1U-N8R2: RF TXRX MOD BT WIFIU.FL SMD; Manufacturer: Espressif Systems; Item Type: Module; Supplier: Digikey; LCSC Part Number: 1965-ESP32-S3-WROOM-1U-N8R2CT-ND; Manufacturer Part Number: ESP32-S3-WROOM-1U-N8R2; RoHS: No; Stock: 6440; Pricing: 1=5.71, 10=4.941, 25=4.6748, 100=4.3087, 250=4.0894 (USD)
U5 = HC-12 SMD: HC12 Si4463 433MHZ RF Wireless Serial Module; Manufacturer Part Number: HC-12; Package: Custom; Item Type: Module
U7 = TCA6424ARGJR: IC XPNDR 400KHZ I2C SMBUS 32UQFN; Manufacturer: Texas Instruments; Min Supply Voltage: 1.65V; Max Supply Voltage: 5.5V; Output Current: 25mA; Number of Outputs: 24; Output Type: PUSH-PULL; Supplier: Mouser; Supplier Part Number: 595-TCA6424ARGJR; Manufacturer Part Number: TCA6424ARGJR; RoHS: Yes; Category: Interface ICs; Stock: 59506; Pricing: 1=2.13, 10=1.81, 50=1.81, 100=1.54, 1000=1.05, 10000=0.894 (USD); Case/Package: QFN; Pins: 32; Weight: 0.002116oz; Min Operating Temperature: -40°C; Max Operating Temperature: 85°C; Packaging: Tape and Reel; Number of I/Os: 24; Clock Frequency: 400kHz; Frequency: 400kHz; Series: -; Length: 5.15mm; Width: 5.15mm; Height: 0.6mm; Radiation Hardening: No; Reach SVHC Compliant: No; Lead Free: Lead Free; RoHS Compliant: Yes; ComponentLink1URL: https://datasheet.ciiva.com/1600/tca6424a-1600866.pdf?src-supplier=Newark; ComponentLink1Description: https://datasheet.ciiva.com/1600/tca6424a-1600866.pdf?src-supplier=Newark; ComponentLink2URL: https://datasheet.ciiva.com/1496/1535173-1496151.pdf?src-supplier=Element14; ComponentLink2Description: https://datasheet.ciiva.com/1496/1535173-1496151.pdf?src-supplier=Element14; ComponentLink3URL: https://datasheet.ciiva.com/22652/1699435-22652096.pdf?src-supplier=Element14; ComponentLink3Description: https://datasheet.ciiva.com/22652/1699435-22652096.pdf?src-supplier=Element14; ComponentLink4URL: https://datasheet.ciiva.com/1780/tca6424a-1780437.pdf?src-supplier=Digikey; ComponentLink4Description: https://datasheet.ciiva.com/1780/tca6424a-1780437.pdf?src-supplier=Digikey; ComponentLink5URL: https://datasheet.ciiva.com/4826/scps193b-101393-4826180.pdf?src-supplier=Mouser; ComponentLink5Description: https://datasheet.ciiva.com/4826/scps193b-101393-4826180.pdf?src-supplier=Mouser; ComponentLink6URL: https://datasheet.ciiva.com/15134/getdatasheetpartid-254651-15134577.pdf?src-supplier=Verical; ComponentLink6Description: https://datasheet.ciiva.com/15134/getdatasheetpartid-254651-15134577.pdf?src-supplier=Verical; ComponentLink7URL: https://datasheet.ciiva.com/1505/1535173-1505147.pdf?src-supplier=Farnell; ComponentLink7Description: https://datasheet.ciiva.com/1505/1535173-1505147.pdf?src-supplier=Farnell; ComponentLink8URL: https://datasheet.ciiva.com/1780/tca6424a-1780438.pdf?src-supplier=Digikey; ComponentLink8Description: https://datasheet.ciiva.com/1780/tca6424a-1780438.pdf?src-supplier=Digikey; ComponentLink9URL: https://datasheet.ciiva.com/1780/tca6424a-1780439.pdf?src-supplier=Digikey; ComponentLink9Description: https://datasheet.ciiva.com/1780/tca6424a-1780439.pdf?src-supplier=Digikey; ComponentLink10URL: https://datasheet.ciiva.com/14195/tca6424a-14195387.pdf?src-supplier=Avnet; ComponentLink10Description: https://datasheet.ciiva.com/14195/tca6424a-14195387.pdf?src-supplier=Avnet; ComponentLink11URL: https://datasheet.ciiva.com/41460/001187873-da-01-en-ic-i-o-expander-tca6424argjr-uqfn-32-tid-41460550.pdf?src-supplier=Conrad; ComponentLink11Description: https://datasheet.ciiva.com/41460/001187873-da-01-en-ic-i-o-expander-tca6424argjr-uqfn-32-tid-41460550.pdf?src-supplier=Conrad; LCSC Part Number: C80692; Item Type: IC

## Nets that join several sheets
3V3_WIFI: Power_Sheet (C39.2 U6.2 U6.4), Transmitter_Section (16 pins)
+5V: Power_Sheet (C15.2 D1.1 R11.2 R31.2), Transmitter_Section (D3.2 R35.1 R39.1)
EN: Power_Sheet (R34.1), Transmitter_Section (U2.9)
EN1: Power_Sheet (R28.2 U3.10), Transmitter_Section (U2.19)
EN2: Power_Sheet (R27.1 U3.11), Transmitter_Section (U2.18)
GND: Power_Sheet (33 pins), Transmitter_Section (43 pins)
VBAT: Power_Sheet (C12.2 C13.2 Q2.3 U1.3), Transmitter_Section (C2.1 C33.2 J4.1)